# EasyEDA Pro project ProPrj_ai交互控制系统_2026-10-29.epro, schematic 搭载小智交互模块原理图
Assembly Variant: Basic; Board Name: Board1; Create Date: 2026-10-14; Page Name: P1; Project Name: ai交互控制系统; Schematic Name: Schematic1; Update Date: 2026-10-14; Company: 嘉立创EDA; Page Size: A4; Version: V1.0
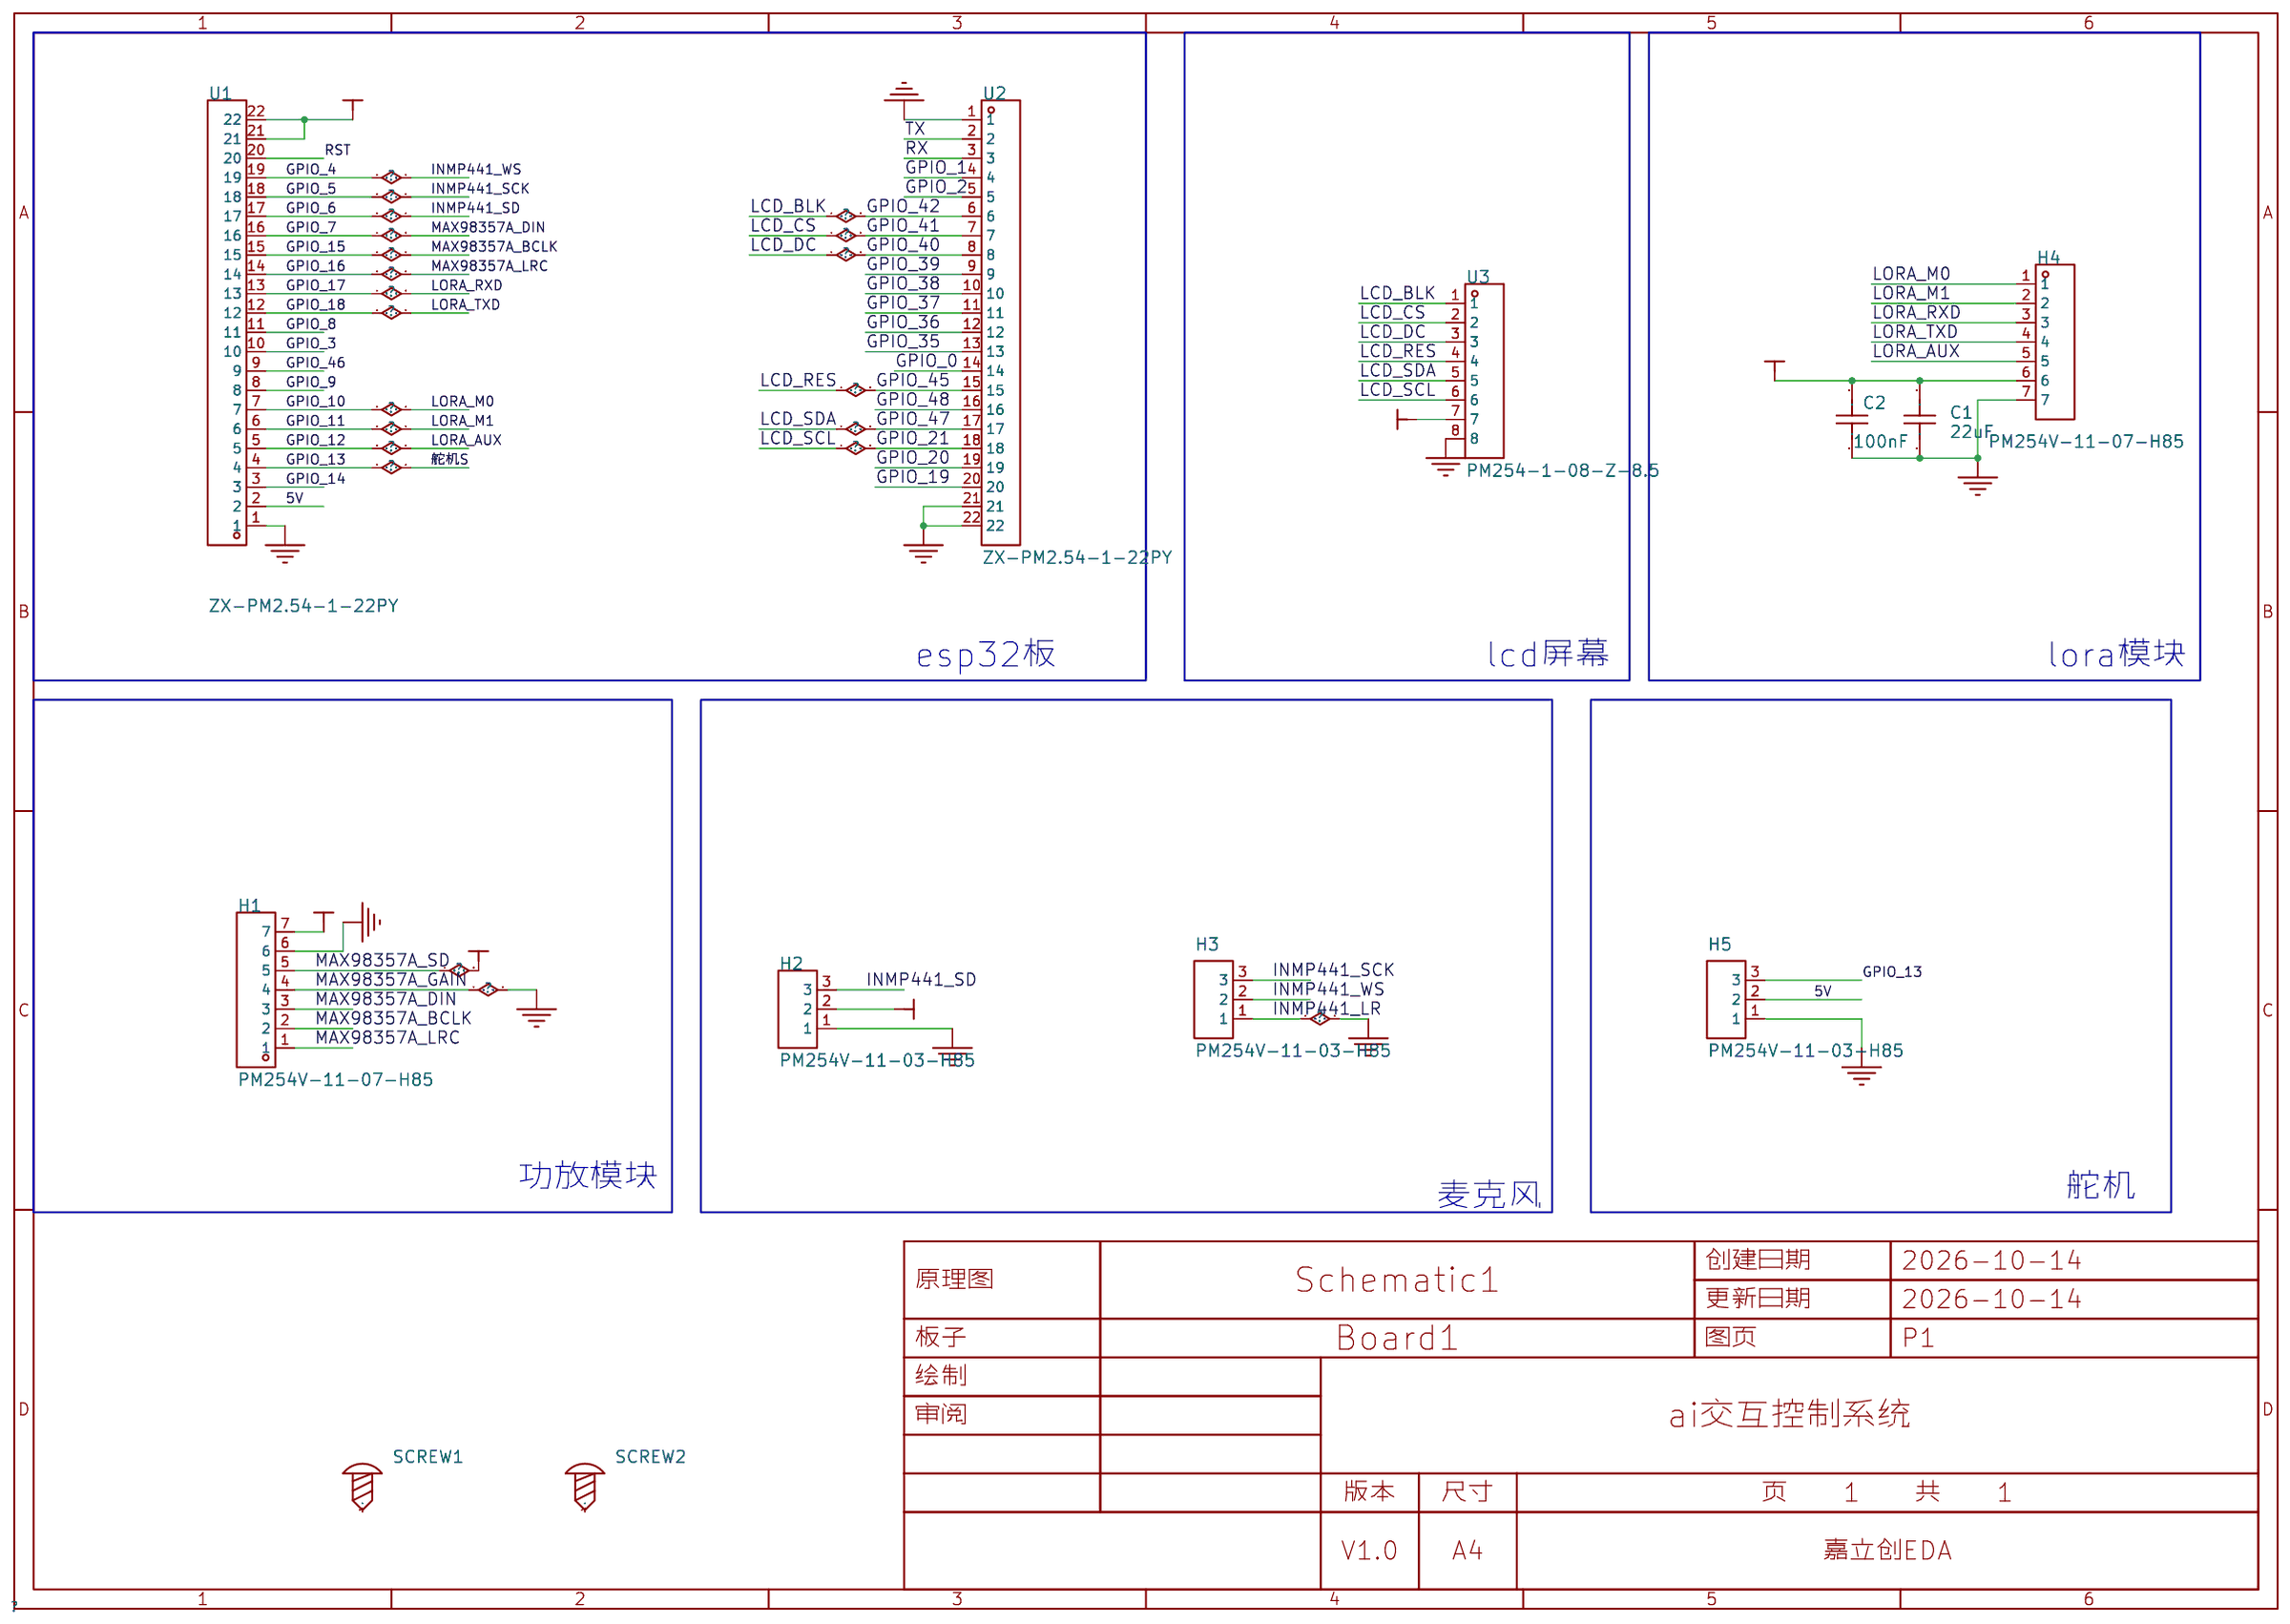
[diagram p1: schematic sheet]

## Parts
C1  22uF  [C0805_1]
C2  100nF  [C0603_2]
H1  PM254V-11-07-H85  [HDR-TH_7P-P2.54-V-F]
H2  PM254V-11-03-H85  [HDR-TH_3P-P2.54-V-F]
H3  PM254V-11-03-H85  [HDR-TH_3P-P2.54-V-F]
H4  PM254V-11-07-H85  [HDR-TH_7P-P2.54-V-F]
H5  PM254V-11-03-H85  [HDR-TH_3P-P2.54-V-F]
SCREW1  -  [M3螺丝]
SCREW2  -  [M3螺丝]
U1  ZX-PM2.54-1-22PY  [HDR-TH_22P-P2.54-V-F]
U2  ZX-PM2.54-1-22PY  [HDR-TH_22P-P2.54-V-F]
U3  PM254-1-08-Z-8.5  [HDR-TH_8P-P2.54-V-F]

## Library data of the parts
C1 = CL21A226MAYNNNE: 容值:22uF;精度:±20%;额定电压:25V;温度系数:X5R;; LCSC Part Name: 22uF ±20% 25V; Supplier Part: C602037; Manufacturer: SAMSUNG(三星); Supplier Footprint: 0805; JLCPCB Part Class: Extended Part; Datasheet: https://item.szlcsc.com/datasheet/CL21A226MAYNNNE/631473.html; Supplier: LCSC; Tolerance: ±20%; Voltage Rating: 25V; Temperature Coefficient: X5R
C2 = FCC0603B104K500CT: 容值:100nF;精度:±10%;额定电压:50V;温度系数:X7R;; LCSC Part Name: 100nF ±10% 50V; Supplier Part: C5137636; Manufacturer: FOJAN(富捷); Supplier Footprint: 0603; JLCPCB Part Class: 扩展库; Datasheet: https://item.szlcsc.com/datasheet/FCC0603B104K500CT/5747088.html; Supplier: LCSC; Tolerance: ±10%; Voltage Rating: 50V; Temperature Coefficient: X7R
H1 = PM254V-11-07-H85: 插孔结构:1x7P;间距:2.54mm;行距:-;圆孔/方孔:方孔;安装方式:直插;排数:单排;总孔位数:7P;额定电流:3A;额定电压:250V;插孔方向:顶部;塑高:-;工作温度:-40℃~+105℃;; LCSC Part Name: 间距:2.54mm 1x7P 直插; Supplier Part: C2832270; Manufacturer: XFCN(兴飞); Supplier Footprint: 插件,P=2.54mm; JLCPCB Part Class: Extended Part; Datasheet: https://item.szlcsc.com/datasheet/PM254V-11-07-H85/2989788.html; Supplier: LCSC; Holes Structure: 1x7P; Pitch: 2.54mm; Circular Hole / Square Hole: 方孔; Mounting Type: 直插; Number of Rows: 单排; Number of Positions: 7P; Current Rating: 3A; Voltage Rating (Max): 250V; Holes Direction: 顶部; Operating Temperature: -40℃~+105℃
H2 H3 H5 = PM254V-11-03-H85: 插孔结构:1x3P;间距:2.54mm;行距:-;圆孔/方孔:方孔;安装方式:直插;排数:单排;总孔位数:3P;额定电流:3A;额定电压:250V;插孔方向:顶部;塑高:8.5mm;触头材质:黄铜;触头镀层:金;工作温度:-40℃~+105℃;; LCSC Part Name: 1x3P 间距:2.54mm 直插; Supplier Part: C541850; Manufacturer: XFCN(兴飞); Supplier Footprint: 插件,P=2.54mm; JLCPCB Part Class: Extended Part; Datasheet: https://item.szlcsc.com/datasheet/PM254V-11-03-H85/562471.html; Supplier: LCSC; Holes Structure: 1x3P; Pitch: 2.54mm; Circular Hole / Square Hole: 方孔; Mounting Type: 直插; Number of Rows: 单排; Number of Positions: 3P; Current Rating: 3A; Voltage Rating (Max): 250V; Holes Direction: 顶部; Insulation Height: 8.5mm; Contact Material: 黄铜; Contact Plating: 金; Operating Temperature: -40℃~+105℃; PIN Length: 3.2mm
H4 = PM254V-11-07-H85: 排数:单排;总孔位数:7P;间距:2.54mm;插孔结构:1x7P;行距:-;安装类型:直插;圆孔/方孔:方孔;额定电流:3A;额定电压:250V;插孔方向:顶部;塑高:-;工作温度范围:-40℃~+105℃;; LCSC Part Name: 间距:2.54mm 1x7P 直插; Supplier Part: C2832270; Manufacturer: XFCN(兴飞); Supplier Footprint: 插件,P=2.54mm; JLCPCB Part Class: Extended Part; Datasheet: https://atta.szlcsc.com/upload/public/pdf/source/20210514/C2832270_F424CC0071A81298BFB56B53406F9842.pdf; Supplier: LCSC; Holes Structure: 1x7P; Pitch: 2.54mm; Circular Hole / Square Hole: 方孔; Mounting Type: 直插; Number of Rows: 单排; Number of Positions: 7P; Current Rating: 3A; Voltage Rating (Max): 250V; Holes Direction: 顶部; Operating Temperature: -40℃~+105℃; Number of Holes: 7P; Current Rating (Max): 3A; Operating Temperature Range: -40℃~+105℃
SCREW1 SCREW2 = M3螺丝: Supplier Footprint: 插件
U1 U2 = ZX-PM2.54-1-22PY: 插孔结构:1x22P;间距:2.54mm;行距:-;圆孔/方孔:方孔;安装方式:直插;排数:单排;总孔位数:22P;额定电流:3A;额定电压:-;插孔方向:顶部;塑高:8.5mm;触头材质:黄铜;触头镀层:金;工作温度:-40℃~+105℃;; LCSC Part Name: 1x22P 间距:2.54mm 直插; Supplier Part: C7499337; Manufacturer: Megastar(兆星); Supplier Footprint: 插件,P=2.54mm; JLCPCB Part Class: Extended Part; Datasheet: https://item.szlcsc.com/datasheet/ZX-PM2.54-1-22PY/8573998.html; Supplier: LCSC; Holes Structure: 1x22P; Pitch: 2.54mm; Circular Hole / Square Hole: 方孔; Mounting Type: 直插; Number of Rows: 单排; Number of Positions: 22P; Current Rating: 3A; Holes Direction: 顶部; Insulation Height: 8.5mm; Contact Material: 黄铜; Contact Plating: 金; Operating Temperature: -40℃~+105℃; PIN Length: 3.2mm
U3 = PM254-1-08-Z-8.5: 插孔结构:1x8P;间距:2.54mm;行距:-;圆孔/方孔:方孔;安装方式:直插;排数:单排;总孔位数:8P;额定电流:3A;额定电压:-;插孔方向:顶部;塑高:8.5mm;触头材质:铜合金;工作温度:-40℃~+105℃;; LCSC Part Name: 1x8P 间距:2.54mm 直插; Supplier Part: C2897371; Manufacturer: HCTL(华灿天禄); Supplier Footprint: 插件,P=2.54mm; JLCPCB Part Class: Extended Part; Datasheet: https://item.szlcsc.com/datasheet/PM254-1-08-Z-8.5/3142376.html; Supplier: LCSC; Holes Structure: 1x8P; Pitch: 2.54mm; Circular Hole / Square Hole: 方孔; Mounting Type: 直插; Number of Rows: 单排; Number of Positions: 8P; Current Rating: 3A; Holes Direction: 顶部; Insulation Height: 8.5mm; Contact Material: 铜合金; Operating Temperature: -40℃~+105℃

## Nets
3V3: H1.5 H1.7 H2.2 U1.21 U1.22 U3.7
5V: C1.2 C2.2 H4.6 H5.2 U1.2
GND: C1.1 C2.1 H1.4 H1.6 H2.1 H3.1 H4.7 H5.1 U1.1 U2.1 U2.21 U2.22 U3.8
GPIO_0: U2.14
GPIO_1: U2.4
GPIO_2: U2.5
GPIO_3: U1.10
GPIO_4: H3.2 U1.19
GPIO_5: H3.3 U1.18
GPIO_6: H2.3 U1.17
GPIO_7: H1.3 U1.16
GPIO_8: U1.11
GPIO_9: U1.8
GPIO_10: H4.1 U1.7
GPIO_11: H4.2 U1.6
GPIO_12: H4.5 U1.5
GPIO_13: H5.3 U1.4
GPIO_14: U1.3
GPIO_15: H1.2 U1.15
GPIO_16: H1.1 U1.14
GPIO_17: H4.3 U1.13
GPIO_18: H4.4 U1.12
GPIO_19: U2.20
GPIO_20: U2.19
GPIO_21: U2.18 U3.6
GPIO_35: U2.13
GPIO_36: U2.12
GPIO_37: U2.11
GPIO_38: U2.10
GPIO_39: U2.9
GPIO_40: U2.8 U3.3
GPIO_41: U2.7 U3.2
GPIO_42: U2.6 U3.1
GPIO_45: U2.15 U3.4
GPIO_46: U1.9
GPIO_47: U2.17 U3.5
GPIO_48: U2.16
RST: U1.20
RX: U2.3
TX: U2.2

Not connected (* = marked no-connect by the designer): SCREW1 1; SCREW2 1

## Notes on the sheet
- esp32板
- lcd屏幕
- lora模块
- 功放模块
- 麦克风
- 舵机
